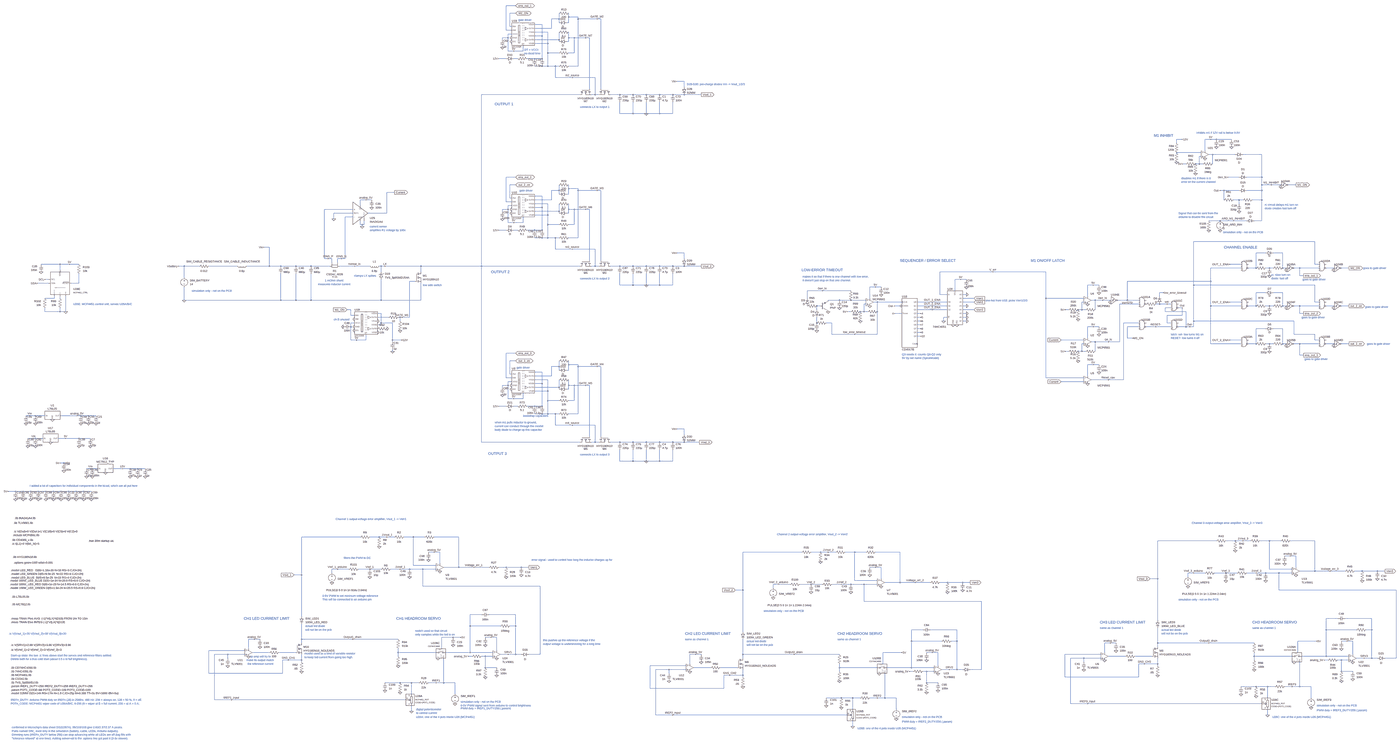
[diagram p0: schematic BOOST_mock_v4.asc, whole sheet]
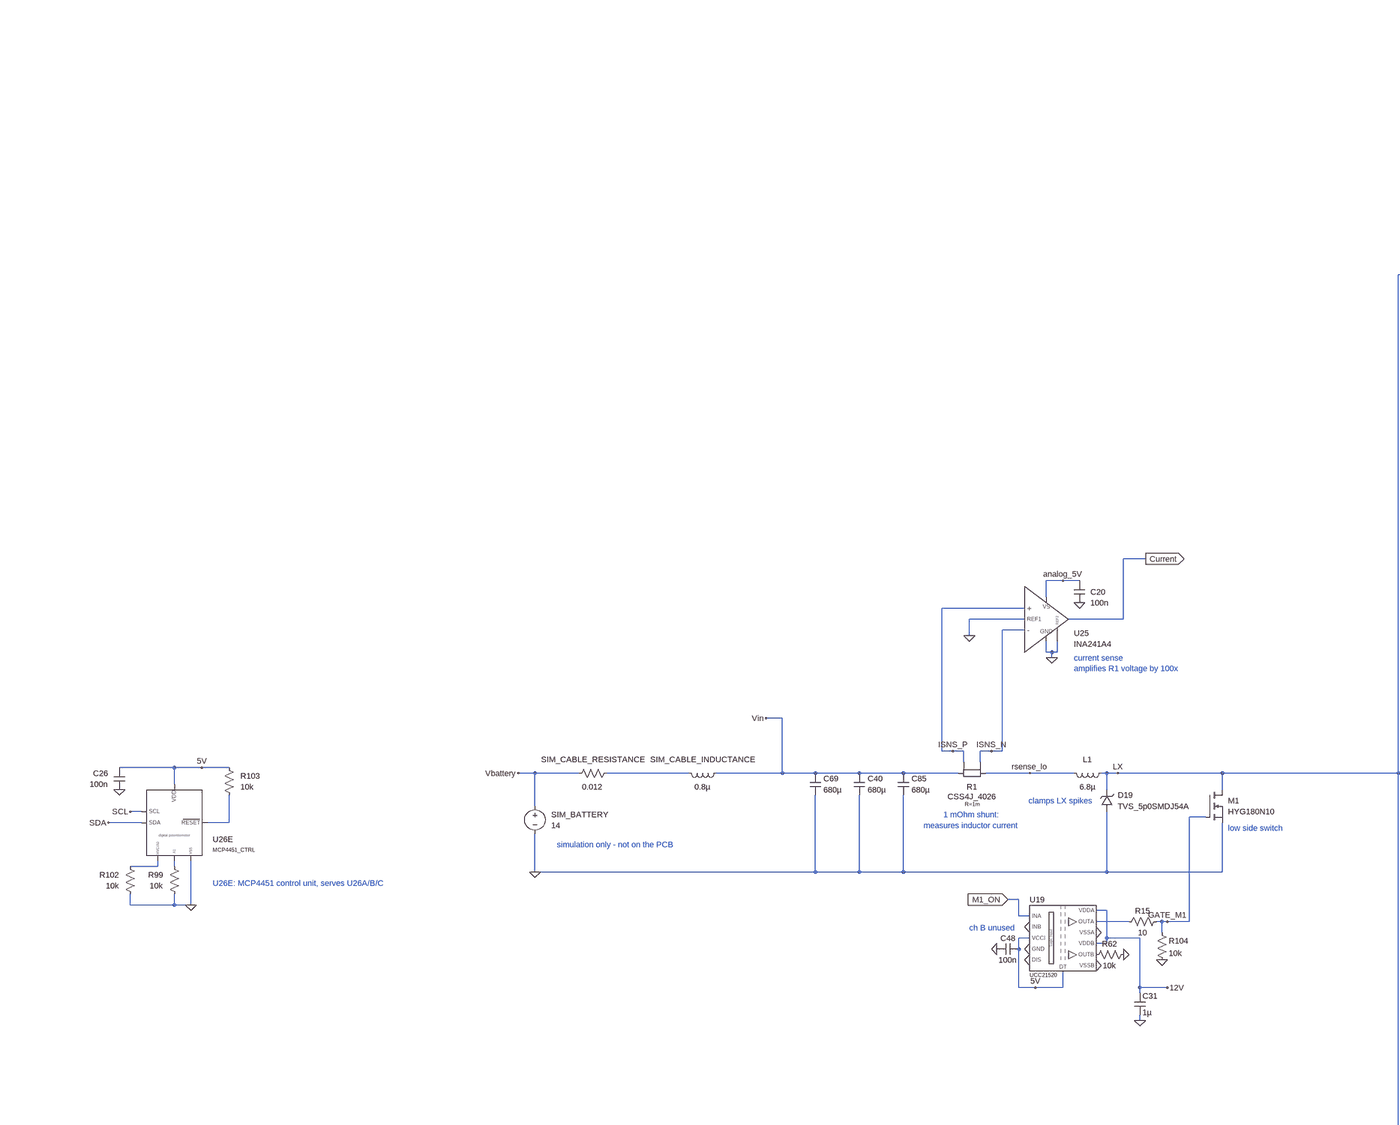
[diagram p1: schematic BOOST_mock_v4.asc, part, row 1 of 2, column 1 of 3]
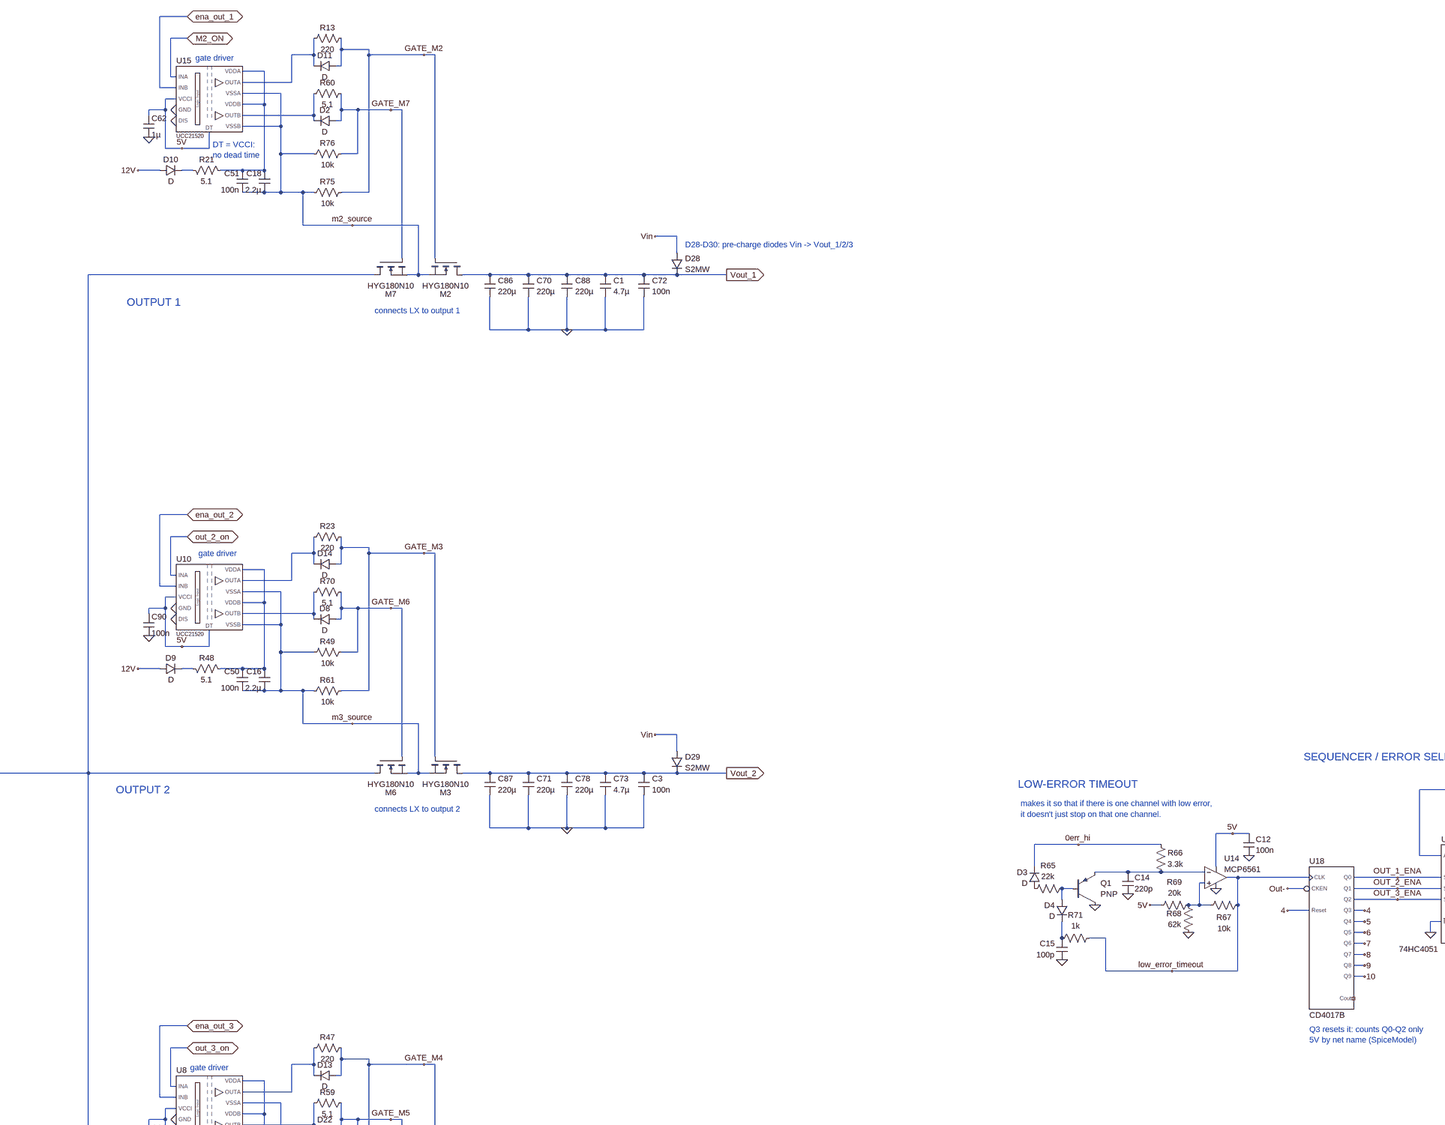
[diagram p2: schematic BOOST_mock_v4.asc, part, row 1 of 2, column 2 of 3]
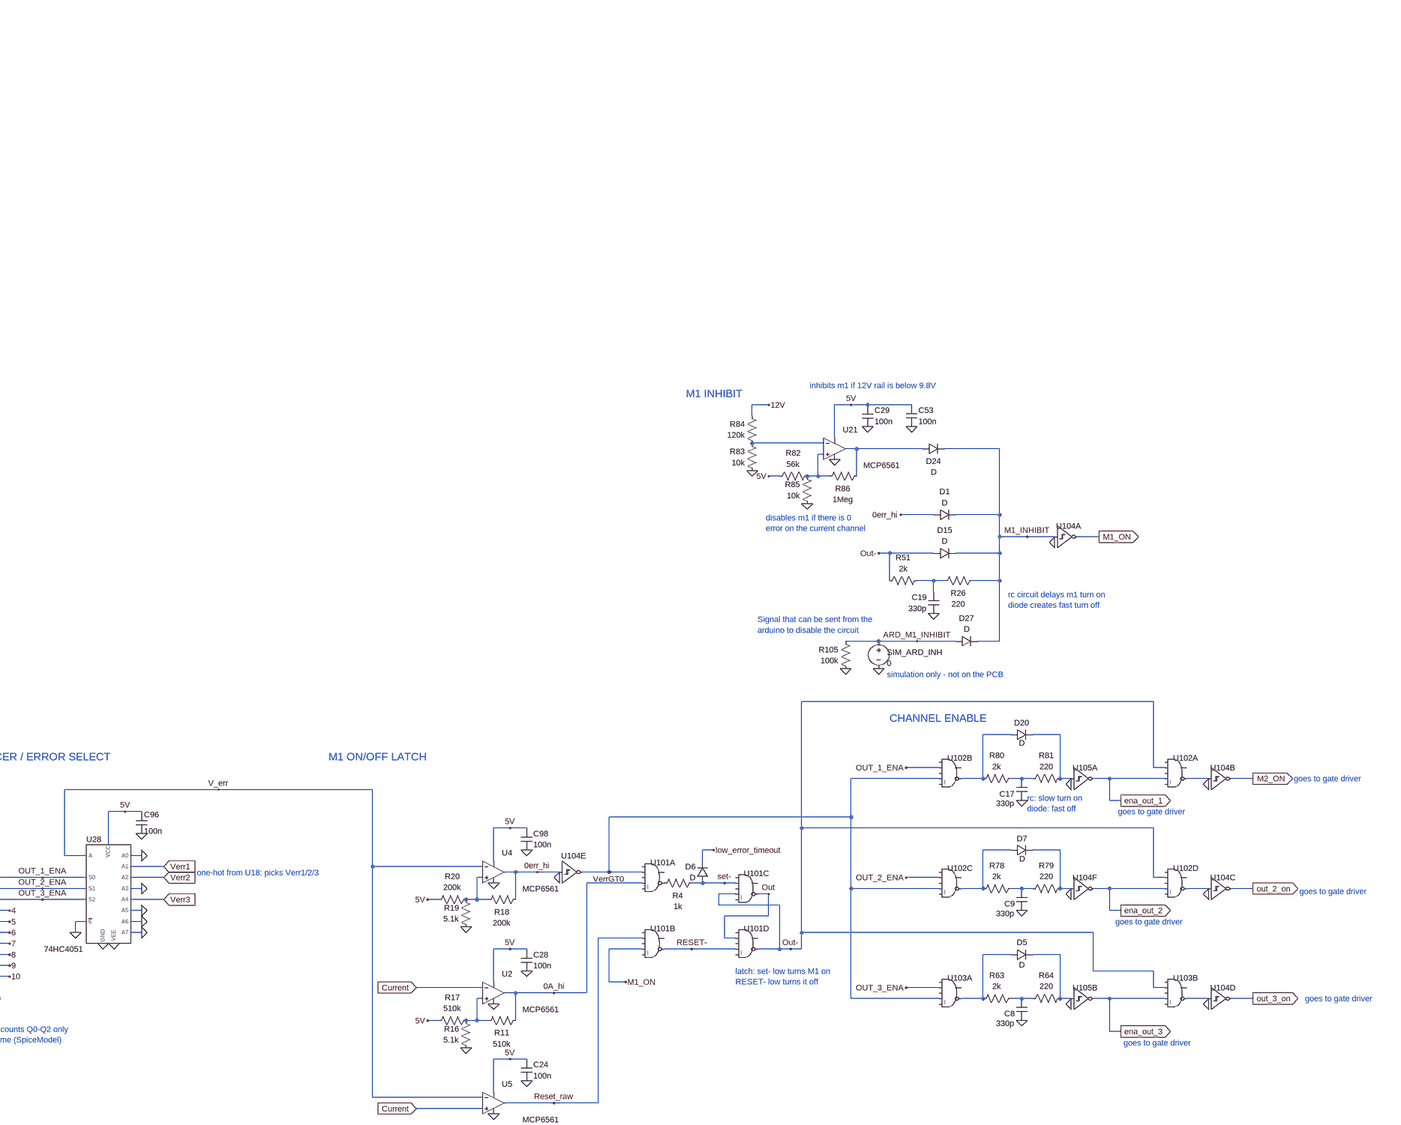
[diagram p3: schematic BOOST_mock_v4.asc, part, row 1 of 2, column 3 of 3]
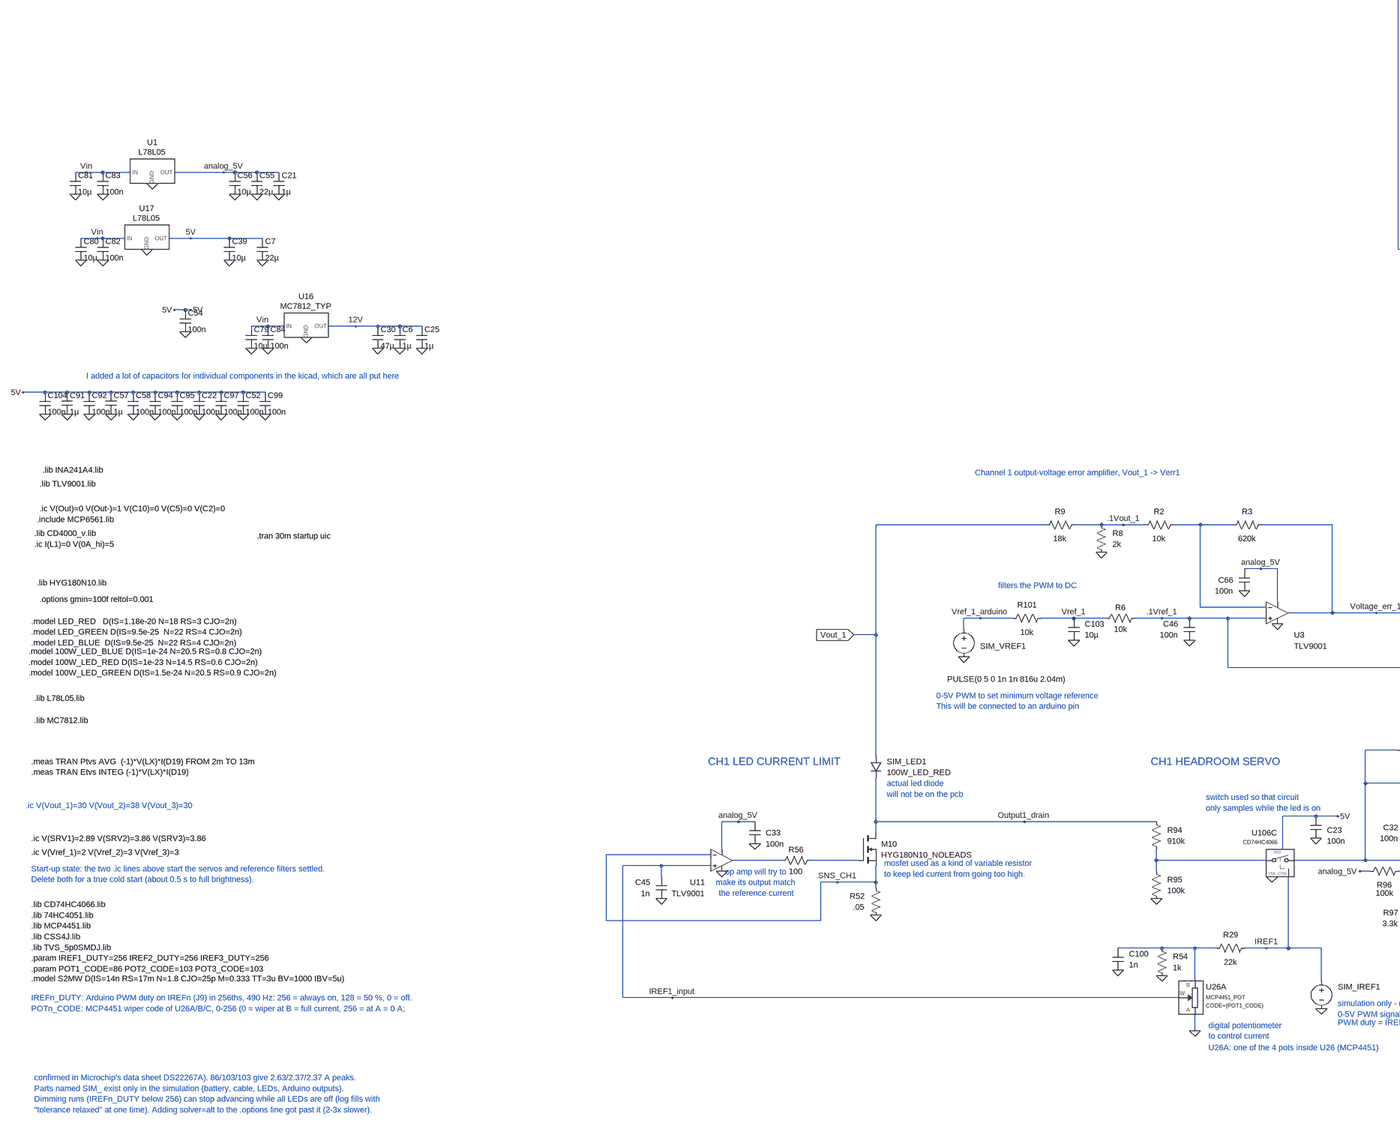
[diagram p4: schematic BOOST_mock_v4.asc, part, row 2 of 2, column 1 of 3]
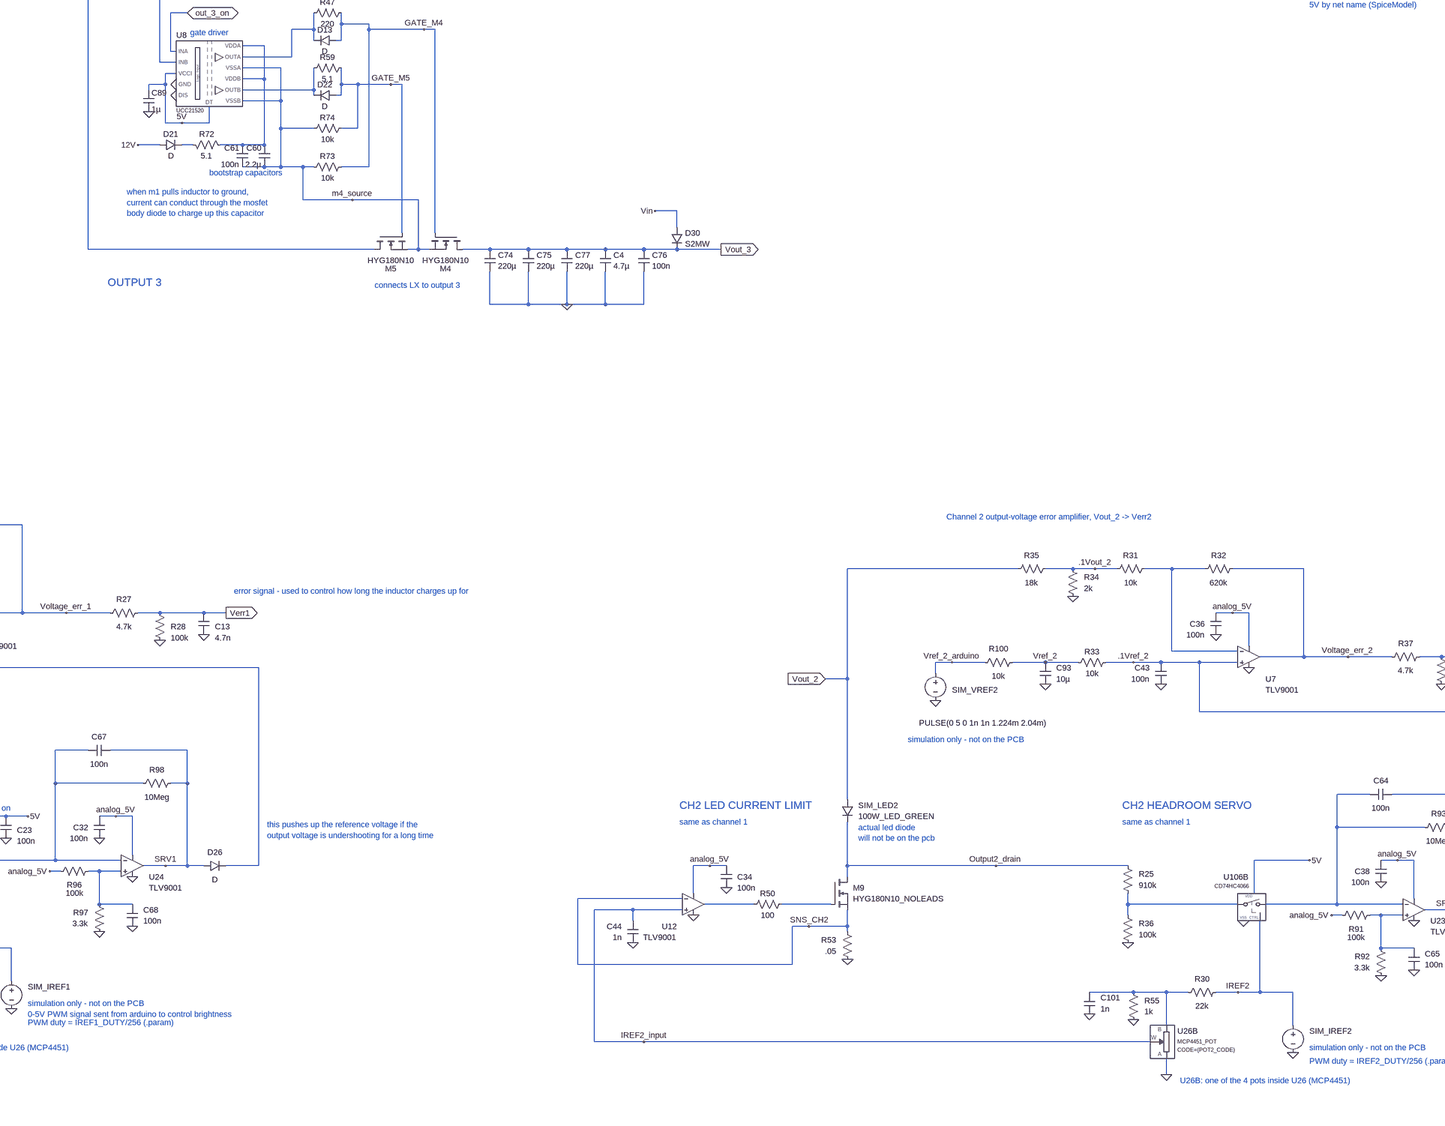
[diagram p5: schematic BOOST_mock_v4.asc, part, row 2 of 2, column 2 of 3]
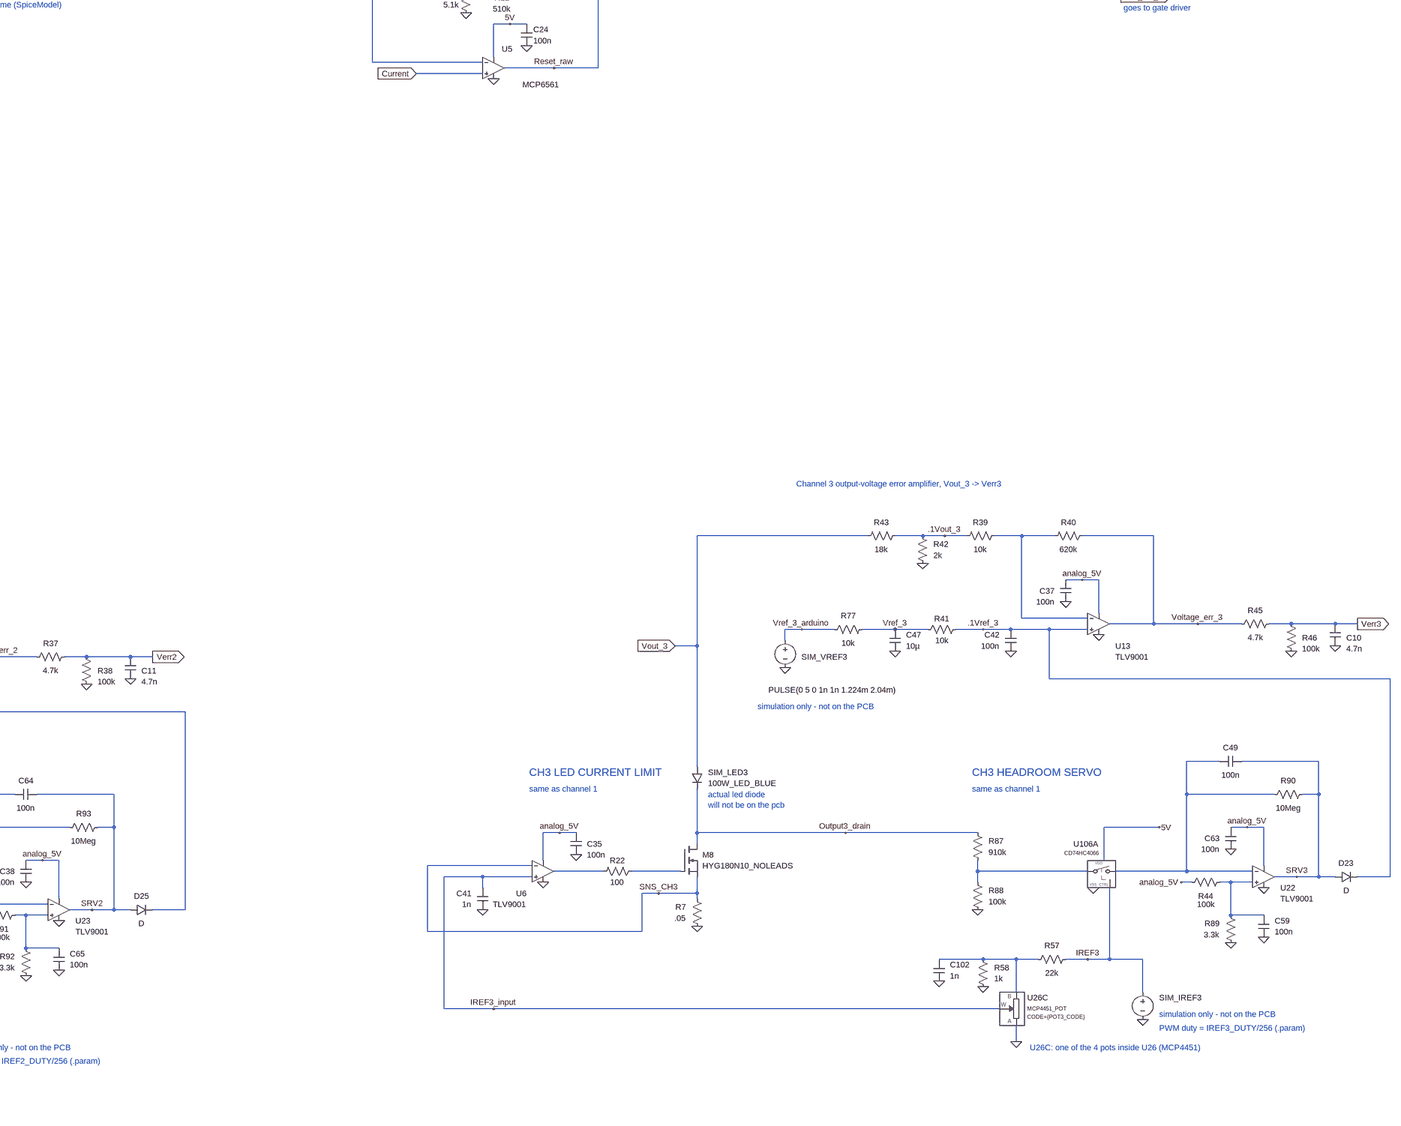
[diagram p6: schematic BOOST_mock_v4.asc, part, row 2 of 2, column 3 of 3]
* BOOST_mock_v4.asc
R15 N029 GATE_M1 10
C7 5V 0 22µ
C30 12V 0 47µ
C31 12V 0 1µ
C39 5V 0 10µ
C54 5V 0 100n
C55 analog_5V 0 22µ
C56 analog_5V 0 10µ
X§U16 Vin 12V 0 MC7812_TYP  ; pins IN OUT GND
X§U17 Vin 5V 0 L78L05  ; pins IN OUT GND
X§U1 Vin analog_5V 0 L78L05  ; pins IN OUT GND
X§U19 M1_ON 0 5V 0 0 5V 12V N029 0 12V P001 0 UCC21520  ; pins INA INB VCCI GND DIS DT VDDA VOUTA VSSA VDDB VOUTB VSSB
X§U8 out_3_on ena_out_3 5V 0 0 5V N037 N036 m4_source N037 N038 m4_source UCC21520  ; pins INA INB VCCI GND DIS DT VDDA VOUTA VSSA VDDB VOUTB VSSB
C60 N037 m4_source 2.2µ
C61 N037 m4_source 100n
R72 N039 N037 5.1
D21 12V N039 D
R47 GATE_M4 N036 220
D13 GATE_M4 N036 D
R59 GATE_M5 N038 5.1
D22 GATE_M5 N038 D
R62 0 P001 10k
C79 Vin 0 10µ
C80 Vin 0 10µ
C81 Vin 0 10µ
C82 Vin 0 100n
C83 Vin 0 100n
C84 Vin 0 100n
R104 GATE_M1 0 10k
R73 m4_source GATE_M4 10k
R74 GATE_M5 m4_source 10k
C94 5V 0 100n
C95 5V 0 100n
C97 5V 0 100n
C99 5V 0 100n
V§SIM_BATTERY Vbattery 0 14
R§SIM_CABLE_RESISTANCE N015 Vbattery 0.012
L§SIM_CABLE_INDUCTANCE Vin N015 0.8µ Rser=1m
C69 Vin 0 680µ V=25 Irms=5.4 Rser=0.008 Lser=4n Rpar=147k
C40 Vin 0 680µ V=25 Irms=5.4 Rser=0.008 Lser=4n Rpar=147k
C85 Vin 0 680µ V=25 Irms=5.4 Rser=0.008 Lser=4n Rpar=147k
X§R1 Vin ISNS_P ISNS_N rsense_lo CSS4J_4026 R=1m  ; pins F1 S1 S2 F2
L1 LX rsense_lo 6.8µ Ipk=55 Rser=1.6m
X§M1 LX GATE_M1 0 HYG180N10  ; pins D G S
D19 0 LX TVS_5p0SMDJ54A
X§M7 LX GATE_M7 m2_source HYG180N10  ; pins D G S
X§M2 Vout_1 GATE_M2 m2_source HYG180N10  ; pins D G S
C86 Vout_1 0 220µ V=50 Irms=4.5 Rser=0.01 Lser=4n Rpar=455k
C70 Vout_1 0 220µ V=50 Irms=3.2 Rser=0.013 Lser=4n Rpar=455k
C88 Vout_1 0 220µ V=50 Irms=3.2 Rser=0.013 Lser=4n Rpar=455k
C1 Vout_1 0 4.7µ
C72 Vout_1 0 100n
D28 Vin Vout_1 S2MW
X§M6 LX GATE_M6 m3_source HYG180N10  ; pins D G S
X§M3 Vout_2 GATE_M3 m3_source HYG180N10  ; pins D G S
C87 Vout_2 0 220µ V=50 Irms=4.5 Rser=0.01 Lser=4n Rpar=455k
C71 Vout_2 0 220µ V=50 Irms=3.2 Rser=0.013 Lser=4n Rpar=455k
C78 Vout_2 0 220µ V=50 Irms=3.2 Rser=0.013 Lser=4n Rpar=455k
C73 Vout_2 0 4.7µ
C3 Vout_2 0 100n
D29 Vin Vout_2 S2MW
X§M5 LX GATE_M5 m4_source HYG180N10  ; pins D G S
X§M4 Vout_3 GATE_M4 m4_source HYG180N10  ; pins D G S
C74 Vout_3 0 220µ V=50 Irms=4.5 Rser=0.01 Lser=4n Rpar=455k
C75 Vout_3 0 220µ V=50 Irms=3.2 Rser=0.013 Lser=4n Rpar=455k
C77 Vout_3 0 220µ V=50 Irms=3.2 Rser=0.013 Lser=4n Rpar=455k
C4 Vout_3 0 4.7µ
C76 Vout_3 0 100n
D30 Vin Vout_3 S2MW
X§U25 ISNS_P ISNS_N analog_5V 0 0 0 Current INA241A4  ; pins IN+ IN- VS GND REF1 REF2 OUT
C20 analog_5V 0 100n
D§SIM_LED1 Vout_1 Output1_drain 100W_LED_RED
X§M10 Output1_drain N047 SNS_CH1 HYG180N10_NOLEADS  ; pins D G S
R52 SNS_CH1 0 .05
X§U11 IREF1_input SNS_CH1 analog_5V 0 N046 TLV9001  ; pins In+ In- V+ V- OUT
C33 analog_5V 0 100n
R56 N047 N046 100
C45 IREF1_input 0 1n
R94 Output1_drain N048 910k
R95 N048 0 100k
X§U106C N048 N043 IREF1 5V 0 CD74HC4066  ; pins A B CTRL VDD VSS
X§U24 N049 N043 analog_5V 0 SRV1 TLV9001  ; pins In+ In- V+ V- OUT
C32 analog_5V 0 100n
C67 N043 SRV1 100n
R98 N043 SRV1 10Meg
D26 SRV1 .1Vref_1 D
R96 analog_5V N049 100k
R97 N049 0 3.3k
C68 N049 0 100n
R54 N058 0 1k
C100 N058 0 1n
X§U26A 0 IREF1_input N058 MCP4451_POT CODE={POT1_CODE}  ; pins A W B
R29 N058 IREF1 22k
V§SIM_IREF1 IREF1 0 PULSE({if(IREF1_DUTY>=256,5,0)} {if(IREF1_DUTY<=0,0,5)} 0 1n 1n {max(IREF1_DUTY/256*2.04m-2n,1n)} 2.04m)
C23 5V 0 100n
X§U26E 5V 0 SCL SDA N021 N022 N018 MCP4451_CTRL  ; pins VDD VSS SCL SDA HVC/A0 A1 RESET
C26 5V 0 100n
R103 5V N018 10k
R102 N021 0 10k
R99 N022 0 10k
R9 .1Vout_1 Vout_1 18k
R8 .1Vout_1 0 2k
R2 N040 .1Vout_1 10k
R3 Voltage_err_1 N040 620k
X§U3 .1Vref_1 N040 analog_5V 0 Voltage_err_1 TLV9001  ; pins In+ In- V+ V- OUT
C66 analog_5V 0 100n
R27 Voltage_err_1 Verr1 4.7k
R28 0 Verr1 100k
C13 0 Verr1 4.7n
C46 .1Vref_1 0 100n
R6 Vref_1 .1Vref_1 10k
V§SIM_VREF1 Vref_1_arduino 0 PULSE(0 5 0 1n 1n 816u 2.04m)
R101 Vref_1_arduino Vref_1 10k
C103 Vref_1 0 10µ
X§U15 M2_ON ena_out_1 5V 0 0 5V N002 N001 m2_source N002 N003 m2_source UCC21520  ; pins INA INB VCCI GND DIS DT VDDA VOUTA VSSA VDDB VOUTB VSSB
R13 GATE_M2 N001 220
D11 GATE_M2 N001 D
R60 N003 GATE_M7 5.1
D2 GATE_M7 N003 D
R75 m2_source GATE_M2 10k
R76 m2_source GATE_M7 10k
D10 12V N004 D
R21 N004 N002 5.1
C18 N002 m2_source 2.2µ
C51 N002 m2_source 100n
X§U10 out_2_on ena_out_2 5V 0 0 5V N009 N008 m3_source N009 N011 m3_source UCC21520  ; pins INA INB VCCI GND DIS DT VDDA VOUTA VSSA VDDB VOUTB VSSB
R23 N008 GATE_M3 220
D14 GATE_M3 N008 D
R70 N011 GATE_M6 5.1
D8 GATE_M6 N011 D
R61 m3_source GATE_M3 10k
R49 GATE_M6 m3_source 10k
D9 12V N012 D
R48 N012 N009 5.1
C16 N009 m3_source 2.2µ
C50 N009 m3_source 100n
C62 0 5V 1µ
C90 5V 0 100n
C89 0 5V 1µ
C48 5V 0 100n
C6 12V 0 1µ
C25 12V 0 1µ
C58 5V 0 100n
C57 0 5V 1µ
C92 5V 0 100n
C91 0 5V 1µ
C104 5V 0 100n
D§SIM_LED2 Vout_2 Output2_drain 100W_LED_GREEN
X§M9 Output2_drain N055 SNS_CH2 HYG180N10_NOLEADS  ; pins D G S
R53 SNS_CH2 0 .05
X§U12 IREF2_input SNS_CH2 analog_5V 0 N054 TLV9001  ; pins In+ In- V+ V- OUT
R50 N055 N054 100
C44 IREF2_input 0 1n
C34 analog_5V 0 100n
V§SIM_IREF2 IREF2 0 PULSE({if(IREF2_DUTY>=256,5,0)} {if(IREF2_DUTY<=0,0,5)} 0 1n 1n {max(IREF2_DUTY/256*2.04m-2n,1n)} 2.04m)
R30 N060 IREF2 22k
R55 N060 0 1k
C101 N060 0 1n
X§U26B 0 IREF2_input N060 MCP4451_POT CODE={POT2_CODE}  ; pins A W B
R25 Output2_drain N056 910k
R36 N056 0 100k
X§U106B N056 N045 IREF2 5V 0 CD74HC4066  ; pins A B CTRL VDD VSS
X§U23 N057 N045 analog_5V 0 SRV2 TLV9001  ; pins In+ In- V+ V- OUT
C64 N045 SRV2 100n
R93 N045 SRV2 10Meg
R91 analog_5V N057 100k
R92 N057 0 3.3k
C65 N057 0 100n
D25 SRV2 .1Vref_2 D
C38 0 analog_5V 100n
V§SIM_VREF2 Vref_2_arduino 0 PULSE(0 5 0 1n 1n 1.224m 2.04m)
R100 Vref_2_arduino Vref_2 10k
C93 Vref_2 0 10µ
R33 Vref_2 .1Vref_2 10k
C43 .1Vref_2 0 100n
R35 .1Vout_2 Vout_2 18k
R34 .1Vout_2 0 2k
R31 N042 .1Vout_2 10k
R32 Voltage_err_2 N042 620k
X§U7 .1Vref_2 N042 analog_5V 0 Voltage_err_2 TLV9001  ; pins In+ In- V+ V- OUT
R37 Voltage_err_2 Verr2 4.7k
R38 0 Verr2 100k
C11 0 Verr2 4.7n
C36 0 analog_5V 100n
D§SIM_LED3 Vout_3 Output3_drain 100W_LED_BLUE
X§M8 Output3_drain N051 SNS_CH3 HYG180N10_NOLEADS  ; pins D G S
R7 SNS_CH3 0 .05
X§U6 IREF3_input SNS_CH3 analog_5V 0 N050 TLV9001  ; pins In+ In- V+ V- OUT
R22 N051 N050 100
C41 IREF3_input 0 1n
C35 analog_5V 0 100n
V§SIM_IREF3 IREF3 0 PULSE({if(IREF3_DUTY>=256,5,0)} {if(IREF3_DUTY<=0,0,5)} 0 1n 1n {max(IREF3_DUTY/256*2.04m-2n,1n)} 2.04m)
R57 N059 IREF3 22k
R58 N059 0 1k
C102 N059 0 1n
X§U26C 0 IREF3_input N059 MCP4451_POT CODE={POT3_CODE}  ; pins A W B
R87 Output3_drain N052 910k
R88 N052 0 100k
X§U106A N052 N044 IREF3 5V 0 CD74HC4066  ; pins A B CTRL VDD VSS
X§U22 N053 N044 analog_5V 0 SRV3 TLV9001  ; pins In+ In- V+ V- OUT
C49 N044 SRV3 100n
R90 N044 SRV3 10Meg
R44 analog_5V N053 100k
R89 N053 0 3.3k
C59 N053 0 100n
D23 SRV3 .1Vref_3 D
C63 analog_5V 0 100n
V§SIM_VREF3 Vref_3_arduino 0 PULSE(0 5 0 1n 1n 1.224m 2.04m)
R77 Vref_3_arduino Vref_3 10k
C47 Vref_3 0 10µ
R41 Vref_3 .1Vref_3 10k
C42 .1Vref_3 0 100n
R43 .1Vout_3 Vout_3 18k
R42 .1Vout_3 0 2k
R39 N041 .1Vout_3 10k
R40 Voltage_err_3 N041 620k
X§U13 .1Vref_3 N041 analog_5V 0 Voltage_err_3 TLV9001  ; pins In+ In- V+ V- OUT
R45 Voltage_err_3 Verr3 4.7k
R46 0 Verr3 100k
C10 0 Verr3 4.7n
C37 0 analog_5V 100n
C22 5V 0 100n
C52 5V 0 100n
C21 analog_5V 0 1µ
X§U14 N025 N023 5V 0 low_error_timeout MCP6561  ; pins In+ In- V+ V- OUT
C12 5V 0 100n
R69 N025 5V 20k
R68 N025 0 62k
R67 low_error_timeout N025 10k
R66 0err_hi N023 3.3k
C14 N023 0 220p
Q1 0 N026 N023 0 PNP
R65 N026 P002 22k
D3 P002 0err_hi D
D4 N026 N030 D
C15 N030 0 100p
R71 N030 low_error_timeout 1k
X§U4 N024 V_err 5V 0 0err_hi MCP6561  ; pins In+ In- V+ V- OUT
C98 5V 0 100n
R20 N024 5V 200k
R19 N024 0 5.1k
R18 0err_hi N024 200k
X§U2 N033 Current 5V 0 0A_hi MCP6561  ; pins In+ In- V+ V- OUT
C28 5V 0 100n
R17 N033 5V 510k
R16 N033 0 5.1k
R11 0A_hi N033 510k
X§U5 Current V_err 5V 0 Reset_raw MCP6561  ; pins In+ In- V+ V- OUT
C24 5V 0 100n
A§U104E 0err_hi 0 0 0 0 VerrGT0 0 0 SCHMITT Vhigh=5 Vlow=0 Vt=2.098 Vh=0.535 Td=7.6n Trise=8.75n Tfall=8.75n Rout=41
A§U101A 0 VerrGT0 0 0A_hi 0 P003 0 0 AND Vhigh=5 Vlow=0 Vt=2.5 Td=2.6n Trise=8.75n Tfall=8.75n Rhigh=45 Rlow=38
R4 set- P003 1k
D6 set- low_error_timeout D
A§U101C 0 set- 0 Out- 0 Out 0 0 AND Vhigh=5 Vlow=0 Vt=2.5 Td=2.6n Trise=8.75n Tfall=8.75n Rhigh=45 Rlow=38
A§U101D 0 Out 0 RESET- 0 Out- 0 0 AND Vhigh=5 Vlow=0 Vt=2.5 Td=2.6n Trise=8.75n Tfall=8.75n Rhigh=45 Rlow=38
A§U101B 0 Reset_raw 0 M1_ON 0 RESET- 0 0 AND Vhigh=5 Vlow=0 Vt=2.5 Td=2.6n Trise=8.75n Tfall=8.75n Rhigh=45 Rlow=38
A§U102B 0 OUT_1_ENA 0 VerrGT0 0 N013 0 0 AND Vhigh=5 Vlow=0 Vt=2.5 Td=2.6n Trise=8.75n Tfall=8.75n Rhigh=45 Rlow=38
R80 N016 N013 2k
C17 0 N016 330p
R81 N016 N014 220
D20 N013 N014 D
A§U105A N014 0 0 0 0 ena_out_1 0 0 SCHMITT Vhigh=5 Vlow=0 Vt=2.098 Vh=0.535 Td=7.6n Trise=8.75n Tfall=8.75n Rout=41
A§U102A 0 Out- 0 ena_out_1 0 N017 0 0 AND Vhigh=5 Vlow=0 Vt=2.5 Td=2.6n Trise=8.75n Tfall=8.75n Rhigh=45 Rlow=38
A§U104B N017 0 0 0 0 M2_ON 0 0 SCHMITT Vhigh=5 Vlow=0 Vt=2.098 Vh=0.535 Td=7.6n Trise=8.75n Tfall=8.75n Rout=41
A§U102C 0 OUT_2_ENA 0 VerrGT0 0 N019 0 0 AND Vhigh=5 Vlow=0 Vt=2.5 Td=2.6n Trise=8.75n Tfall=8.75n Rhigh=45 Rlow=38
R78 N027 N019 2k
C9 0 N027 330p
R79 N027 N020 220
D7 N019 N020 D
A§U104F N020 0 0 0 0 ena_out_2 0 0 SCHMITT Vhigh=5 Vlow=0 Vt=2.098 Vh=0.535 Td=7.6n Trise=8.75n Tfall=8.75n Rout=41
A§U102D 0 Out- 0 ena_out_2 0 N028 0 0 AND Vhigh=5 Vlow=0 Vt=2.5 Td=2.6n Trise=8.75n Tfall=8.75n Rhigh=45 Rlow=38
A§U104C N028 0 0 0 0 out_2_on 0 0 SCHMITT Vhigh=5 Vlow=0 Vt=2.098 Vh=0.535 Td=7.6n Trise=8.75n Tfall=8.75n Rout=41
A§U103A 0 OUT_3_ENA 0 VerrGT0 0 N031 0 0 AND Vhigh=5 Vlow=0 Vt=2.5 Td=2.6n Trise=8.75n Tfall=8.75n Rhigh=45 Rlow=38
R63 N034 N031 2k
C8 0 N034 330p
R64 N034 N032 220
D5 N031 N032 D
A§U105B N032 0 0 0 0 ena_out_3 0 0 SCHMITT Vhigh=5 Vlow=0 Vt=2.098 Vh=0.535 Td=7.6n Trise=8.75n Tfall=8.75n Rout=41
A§U103B 0 Out- 0 ena_out_3 0 N035 0 0 AND Vhigh=5 Vlow=0 Vt=2.5 Td=2.6n Trise=8.75n Tfall=8.75n Rhigh=45 Rlow=38
A§U104D N035 0 0 0 0 out_3_on 0 0 SCHMITT Vhigh=5 Vlow=0 Vt=2.098 Vh=0.535 Td=7.6n Trise=8.75n Tfall=8.75n Rout=41
X§U21 N007 N005 5V 0 N006 MCP6561  ; pins In+ In- V+ V- OUT
C29 5V 0 100n
C53 0 5V 100n
R82 5V N007 56k
R85 N007 0 10k
R86 N006 N007 1Meg
R84 12V N005 120k
R83 N005 0 10k
D24 N006 M1_INHIBIT D
D1 0err_hi M1_INHIBIT D
D15 Out- M1_INHIBIT D
R51 Out- N010 2k
C19 N010 0 330p
R26 M1_INHIBIT N010 220
D27 ARD_M1_INHIBIT M1_INHIBIT D
R105 ARD_M1_INHIBIT 0 100k
V§SIM_ARD_INH ARD_M1_INHIBIT 0 0
A§U104A M1_INHIBIT 0 0 0 0 M1_ON 0 0 SCHMITT Vhigh=5 Vlow=0 Vt=2.098 Vh=0.535 Td=7.6n Trise=8.75n Tfall=8.75n Rout=41
X§U18 4 Out- low_error_timeout OUT_1_ENA OUT_2_ENA OUT_3_ENA 4 5 6 7 8 9 10 NC_01 5V 0 CD4017B VDD=5  SPEED=1.35  TRIPDT=5e-9  ; pins MR CPN CP Q0 Q1 Q2 Q3 Q4 Q5 Q6 Q7 Q8 Q9 Q59
X§U28 OUT_1_ENA OUT_2_ENA OUT_3_ENA 0 0 Verr1 Verr2 0 Verr3 0 0 0 V_err 5V 0 0 74HC4051  ; pins A B C INH IO0 IO1 IO2 IO3 IO4 IO5 IO6 IO7 IOC VDD VSS VEE
C96 5V 0 100n
.model D D
.lib standard.dio
.model NPN NPN
.model PNP PNP
.lib standard.bjt
.lib TLV9001.lib
.ic V(Out)=0 V(Out-)=1 V(C10)=0 V(C5)=0 V(C2)=0
.include MCP6561.lib
.tran 30m startup uic
.ic I(L1)=0 V(0A_hi)=5
.lib CD4000_v.lib
.lib HYG180N10.lib
.options gmin=100f reltol=0.001
.lib INA241A4.lib
.model LED_RED   D(IS=1.18e-20 N=18 RS=3 CJO=2n)
.model LED_GREEN D(IS=9.5e-25  N=22 RS=4 CJO=2n)
.model LED_BLUE  D(IS=9.5e-25  N=22 RS=4 CJO=2n)
.model 100W_LED_BLUE D(IS=1e-24 N=20.5 RS=0.8 CJO=2n)
.model 100W_LED_RED D(IS=1e-23 N=14.5 RS=0.6 CJO=2n)
.model 100W_LED_GREEN D(IS=1.5e-24 N=20.5 RS=0.9 CJO=2n)
.lib L78L05.lib
.lib MC7812.lib
.meas TRAN Ptvs AVG  (-1)*V(LX)*I(D19) FROM 2m TO 13m
.meas TRAN Etvs INTEG (-1)*V(LX)*I(D19)
* .ic V(Vout_1)=30 V(Vout_2)=38 V(Vout_3)=30
.ic V(SRV1)=2.89 V(SRV2)=3.86 V(SRV3)=3.86
.ic V(Vref_1)=2 V(Vref_2)=3 V(Vref_3)=3
* Start-up state: the two .ic lines above start the servos and reference filters settled.
* Delete both for a true cold start (about 0.5 s to full brightness).
.lib CD74HC4066.lib
.lib 74HC4051.lib
.lib MCP4451.lib
.lib CSS4J.lib
.lib TVS_5p0SMDJ.lib
.param IREF1_DUTY=256 IREF2_DUTY=256 IREF3_DUTY=256
.param POT1_CODE=86 POT2_CODE=103 POT3_CODE=103
* IREFn_DUTY: Arduino PWM duty on IREFn (J9) in 256ths, 490 Hz: 256 = always on, 128 = 50 %, 0 = off.
* POTn_CODE: MCP4451 wiper code of U26A/B/C, 0-256 (0 = wiper at B = full current, 256 = at A = 0 A;
* I added a lot of capacitors for individual components in the kicad, which are all put here
* confirmed in Microchip's data sheet DS22267A). 86/103/103 give 2.63/2.37/2.37 A peaks.
* Parts named SIM_ exist only in the simulation (battery, cable, LEDs, Arduino outputs).
* Dimming runs (IREFn_DUTY below 256) can stop advancing while all LEDs are off (log fills with
* "tolerance relaxed" at one time). Adding solver=alt to the .options line got past it (2-3x slower).
.model S2MW D(IS=14n RS=17m N=1.8 CJO=25p M=0.333 TT=3u BV=1000 IBV=5u)
* simulation only - not on the PCB
* D28-D30: pre-charge diodes Vin -> Vout_1/2/3
* actual led diode
* will not be on the pcb
* simulation only - not on the PCB
* 0-5V PWM signal sent from arduino to control brightness
* U26E: MCP4451 control unit, serves U26A/B/C
* Channel 1 output-voltage error amplifier, Vout_1 -> Verr1
* 0-5V PWM to set minimum voltage reference
* This will be connected to an arduino pin
* this pushes up the reference voltage if the
* output voltage is undershooting for a long time
* digital potentiometer
* to control current
* switch used so that circuit
* only samples while the led is on
* error signal - used to control how long the inductor charges up for
* mosfet used as a kind of variable resistor
* to keep led current from going too high.
* op amp will try to
* make its output match
* the reference current
* PWM duty = IREF1_DUTY/256 (.param)
* 1 mOhm shunt:
* measures inductor current
* current sense
* amplifies R1 voltage by 100x
* low side switch
* clamps LX spikes
* connects LX to output 1
* connects LX to output 2
* connects LX to output 3
* filters the PWM to DC
* U26A: one of the 4 pots inside U26 (MCP4451)
* OUTPUT 1
* OUTPUT 2
* OUTPUT 3
* CH1 LED CURRENT LIMIT
* CH1 HEADROOM SERVO
* when m1 pulls inductor to ground,
* current can conduct through the mosfet
* body diode to charge up this capacitor
* actual led diode
* will not be on the pcb
* simulation only - not on the PCB
* Channel 2 output-voltage error amplifier, Vout_2 -> Verr2
* simulation only - not on the PCB
* PWM duty = IREF2_DUTY/256 (.param)
* U26B: one of the 4 pots inside U26 (MCP4451)
* CH2 LED CURRENT LIMIT
* CH2 HEADROOM SERVO
* same as channel 1
* actual led diode
* will not be on the pcb
* simulation only - not on the PCB
* Channel 3 output-voltage error amplifier, Vout_3 -> Verr3
* simulation only - not on the PCB
* PWM duty = IREF3_DUTY/256 (.param)
* U26C: one of the 4 pots inside U26 (MCP4451)
* CH3 LED CURRENT LIMIT
* CH3 HEADROOM SERVO
* same as channel 1
* LOW-ERROR TIMEOUT
* SEQUENCER / ERROR SELECT
* M1 ON/OFF LATCH
* CHANNEL ENABLE
* M1 INHIBIT
* simulation only - not on the PCB
* makes it so that if there is one channel with low error,
* it doesn't just stop on that one channel.
* rc circuit delays m1 turn on
* diode creates fast turn off
* inhibits m1 if 12V rail is below 9.8V
* disables m1 if there is 0
* error on the current channel
* Signal that can be sent from the
* arduino to disable the circuit
* goes to gate driver
* goes to gate driver
* goes to gate driver
* goes to gate driver
* gate driver
* gate driver
* gate driver
* bootstrap capacitors
* goes to gate driver
* goes to gate driver
* one-hot from U18: picks Verr1/2/3
* Q3 resets it: counts Q0-Q2 only
* 5V by net name (SpiceModel)
* latch: set- low turns M1 on
* RESET- low turns it off
* rc: slow turn on
* diode: fast off
* DT = VCCI:
* no dead time
* ch B unused
* same as channel 1
* same as channel 1
.lib MC7812.lib
.lib L78L05.lib
.lib UCC21520.lib
.lib CSS4J.lib
.lib INA241A4.lib
.lib CD74HC4066.lib
.lib MCP4451.lib
.lib 74HC4051.lib
.backanno
.end